# Altium schematic sheet 灯板.SchDoc
size A4
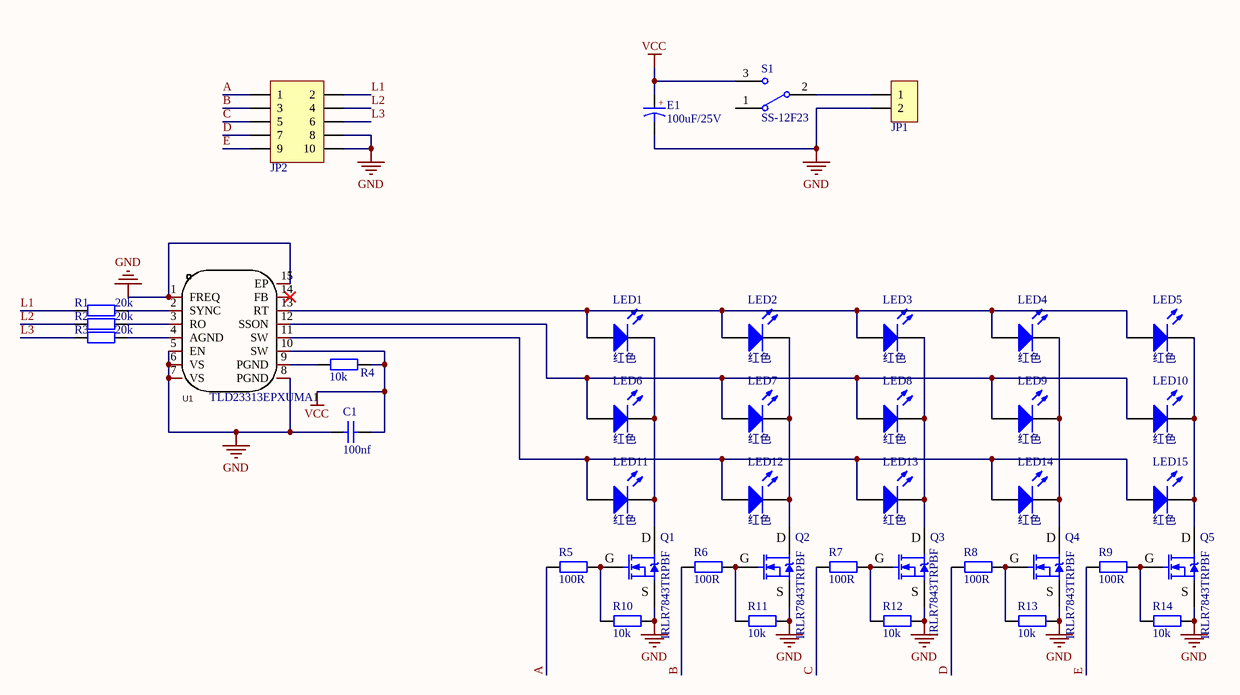
[diagram p0: 灯板.SchDoc]

## Parts
C1  100nf  [C0805_L]
E1  100uF/25V  [CS 8*7 - B]
JP1  HDR-1X2  [KF350-2P]  (value not drawn)
JP2  Header 5X2  [IDC2.54-LI-2x5P]  (value not drawn)
LED1  红色  [LED0805_G]
LED2  红色  [LED0805_G]
LED3  红色  [LED0805_G]
LED4  红色  [LED0805_G]
LED5  红色  [LED0805_G]
LED6  红色  [LED0805_G]
LED7  红色  [LED0805_G]
LED8  红色  [LED0805_G]
LED9  红色  [LED0805_G]
LED10  红色  [LED0805_G]
LED11  红色  [LED0805_G]
LED12  红色  [LED0805_G]
LED13  红色  [LED0805_G]
LED14  红色  [LED0805_G]
LED15  红色  [LED0805_G]
Q1  IRLR7843TRPBF  [TO252]
Q2  IRLR7843TRPBF  [TO252]
Q3  IRLR7843TRPBF  [TO252]
Q4  IRLR7843TRPBF  [TO252]
Q5  IRLR7843TRPBF  [TO252]
R1  20k  [R0603_L]
R2  20k  [R0603_L]
R3  20k  [R0603_L]
R4  10k  [R0603_L]
R5  100R  [R0603_L]
R6  100R  [R0603_L]
R7  100R  [R0603_L]
R8  100R  [R0603_L]
R9  100R  [R0603_L]
R10  10k  [R0603_L]
R11  10k  [R0603_L]
R12  10k  [R0603_L]
R13  10k  [R0603_L]
R14  10k  [R0603_L]
S1  SS-12F23  [SS-12D10]
U1  TLD23313EPXUMA1  [PG-TSDSO-14_L4.9-W3.9-P0.65-LS6.0-BL-EP]

## Nets
GND: C1.2 E1.2(K) JP1.2 JP2.8 JP2.10 Q1.3(S) Q2.3(S) Q3.3(S) Q4.3(S) Q5.3(S) R10.2 R11.2 R12.2 R13.2 R14.2 U1.1(FREQ) U1.5(EN) U1.6(VS) U1.7(VS) U1.8(PGND) U1.15(EP)
VCC: C1.1 E1.1(A) R4.2 S1.3 U1.10(SW)
A: JP2.1 R5.1
B: JP2.3 R6.1
C: JP2.5 R7.1
D: JP2.7 R8.1
E: JP2.9 R9.1
L1: JP2.2 R1.1
L2: JP2.4 R2.1
L3: JP2.6 R3.1
NetJP1_1: JP1.1 S1.2
NetLED1_1: LED1.1(A) LED2.1(A) LED3.1(A) LED4.1(A) LED5.1(A) U1.13(RT)
NetLED1_2: LED1.2(K) LED6.2(K) LED11.2(K) Q1.2(D)
NetLED2_2: LED2.2(K) LED7.2(K) LED12.2(K) Q2.2(D)
NetLED3_2: LED3.2(K) LED8.2(K) LED13.2(K) Q3.2(D)
NetLED4_2: LED4.2(K) LED9.2(K) LED14.2(K) Q4.2(D)
NetLED5_2: LED5.2(K) LED10.2(K) LED15.2(K) Q5.2(D)
NetLED6_1: LED6.1(A) LED7.1(A) LED8.1(A) LED9.1(A) LED10.1(A) U1.12(SSON)
NetLED11_1: LED11.1(A) LED12.1(A) LED13.1(A) LED14.1(A) LED15.1(A) U1.11(SW)
NetQ1_1: Q1.1(G) R5.2 R10.1
NetQ2_1: Q2.1(G) R6.2 R11.1
NetQ3_1: Q3.1(G) R7.2 R12.1
NetQ4_1: Q4.1(G) R8.2 R13.1
NetQ5_1: Q5.1(G) R9.2 R14.1
NetR1_2: R1.2 U1.2(SYNC)
NetR2_2: R2.2 U1.3(RO)
NetR3_2: R3.2 U1.4(AGND)
NetR4_1: R4.1 U1.9(PGND)

Not connected (* = marked no-connect by the designer): S1 1; U1 14(FB)*

## Notes on the sheet
- (in symbol CT) +

## Library data of the parts
C1 = C: 贴片电容/MLCC电容; BOM名称: 无极性贴片电容; 联系下单店铺卖家 免费帮你查找封装: 联系下单店铺卖家 免费技术支持
E1 = CT: 贴片钽电容; 联系下单店铺卖家 免费帮你查找封装: 联系下单店铺卖家 免费技术支持; BOM名称: 贴片钽电容
JP1 = Header 2: 2P接插件; 联系卖家，免费技术支持: 唯一出售店铺网址https://shop463601444.taobao.com; BOM名称: 2P接插件
JP2 = Header 5X2: 5*2P接插件; 联系卖家，免费查找封装: 唯一出售店铺网址https://shop463601444.taobao.com; 封装库来自淘宝卖家ID：黄晶宝石: 其他店铺购入均为盗版封装库，请立即申请退款，本店现金奖励50~200元; BOM名称: 5*2P接插件
LED1-LED15 = LED: 贴片LED; 封装库来自淘宝卖家：黄晶宝石: 其他店铺购入均为盗版封装库，请立即申请退款，本店现金奖励200~1000元; BOM名称: 贴片LED
Q1-Q5 = IRLR7843: N沟道 30V/161A; BOM名称: N沟场效应管; 8元以下特价购入的买家: 还可以联系卖家 远程指导AD软件使用
R1-R14 = R: 贴片电阻; 联系下单店铺卖家 免费帮你查找封装: 联系下单店铺卖家 免费技术支持; BOM名称: 贴片电阻
S1 = SSW-1P: 1路波动开关; BOM名称: 波动开关; 联系卖家，免费查找封装: 唯一出售店铺网址https://shop463601444.taobao.com; 封装库来自淘宝卖家：黄晶宝石: 其他店铺购入均为盗版封装库，请立即申请退款，本店现金奖励200~1000元
U1 = TLD23313EPXUMA1: Manufacturer: Infineon(英飞凌); Add into BOM: yes; Name: TLD23313EPXUMA1; Symbol: TLD23313EPXUMA1; Device: TLD23313EPXUMA1; LCSC Part Name: TLD23313EPXUMA1; Supplier Part: C3034685; Manufacturer Part: TLD23313EPXUMA1; Supplier Footprint: PG-TSDSO-14; JLCPCB Part Class: Extended Part; Datasheet: https://atta.szlcsc.com/upload/public/pdf/source/20220609/3E1B98B62208CAF79E791631086D82DE.pdf; Supplier: LCSC; Convert to PCB: yes